# Altium schematic sheet Buck.SchDoc
size 420 x 297 mm; SheetNumber: 1; SheetTotal: 1; ENG_APP_DATE: --/--/--; DSN_APP_DATE: --/--/--; CHK_APP_DATE: --/--/--; SPICEModelCacheCJHNTGTK: <root> / <DocumentId>CJHNTGTK</DocumentId> / <CacheFrame Number="0"> / <Model Name="mcp6561" Kind="CKT"> / <Text>.SUBCKT MCP6561 1 2 3 4 5 / *               | | | | | / *               | | | | Output / *               | | | Negative Supply / *               | | Positive Supply / *               | Inverting Input / *               Non-inverting Input / * / ******************************************************************************** / * Software License Agreement                                                   * / *                                                                              * / * The software supplied herewith by Microchip Technology Incorporated (the     * / * 'Company') is intended and supplied to you, the Company's customer, for use  * / * soley and exclusively on Microchip products.                                 * / *                                                                              * / * The software is owned by the Company and/or its supplier, and is protected   * / * under applicable copyright laws. All rights are reserved. Any use in         * / * violation of the foregoing restrictions may subject the user to criminal     * / * sanctions under applicable laws, as well as to civil liability for the       * / * breach of the terms and conditions of this license.                          * / *                                                                              * / * THIS SOFTWARE IS PROVIDED IN AN 'AS IS' CONDITION. NO WARRANTIES, WHETHER    * / * EXPRESS, IMPLIED OR STATUTORY, INCLUDING, BUT NOT LIMITED TO, IMPLIED        * / * WARRANTIES OF MERCHANTABILITY AND FITNESS FOR A PARTICULAR PURPOSE APPLY TO  * / * THIS SOFTWARE. THE COMPANY SHALL NOT, IN ANY CIRCUMSTANCES, BE LIABLE FOR    * / * SPECIAL, INCIDENTAL OR CONSEQUENTIAL DAMAGES, FOR ANY REASON WHATSOEVER.     * / ******************************************************************************** / * / * The following op-amps are covered by this model: / *      MCP6561/1R/1U/2/4 / * / * / * Revision History: / *      REV A: 31-Jan-11, Created model / *      REV B: 09-Apr-11, Fixed output voltage swing / * / * Recommendations: / *      Use PSPICE (or SPICE 2G6; other simulators may require translation) / *      For a quick, effective design, use a combination of: data sheet / *            specs, bench testing, and simulations with this macromodel / *      For high impedance circuits, set GMIN=100F in the .OPTIONS statement / *      Can disable Hysteresis for faster response in large circuits by adding comments / *      in front of statements flagged below / * / * Supported: / *      Typical performance for temperature range (-40 to 125) degrees Celsius / *      DC, AC, Transient, and Noise analyses. / *      Most specs, including: offsets, DC PSRR, DC CMRR, input impedance, / *            open loop gain, voltage ranges, supply current, ... , etc. / *      Temperature effects for Ibias, Iquiescent, Iout short circuit / *            current, Vsat on both rails, Slew Rate vs. Temp and P.S. / * / * Not Supported: / *      Some Variation in specs vs. Power Supply Voltage / *      Vos distribution, Ib distribution for Monte Carlo / *      Distortion (detailed non-linear behavior) / *      Some Temperature analysis / *      Process variation / *      Behavior outside normal operating region / * / * Input Stage / V10  3 10 -450M / R10 10 11 690K / R11 10 12 690K / G10 10 11 10 11 144U / G11 10 12 10 12 144U / C11 11 12 576E-18 / C12  1  0 4.00P / *E12 71 14 POLY(6) 20 0 21 0 22 0 23 0 26 0 27 0   2.1M 86.2K 86.2K 86.2K 86.2K 1 1 / E12 71 14 POLY(7) 20 0 21 0 22 0 23 0 26 0 27 0 111 0 / + 1.5M 55 55 15 15 1 1 -.5M / * LINE ABOVE FOR HYSTERESIS, LINE BELOW FOR NO HYSTERESIS / *+ 1.5M 55 55 15 15 1 1 0 / G12 1 0 62 0 1m / G13 1 2 63 0 1u / M12 11 14 15 15 NMI / M14 12 2 15 15 NMI / G14 2 0 62 0 1m / C14  2  0 4.00P / I15 15 4 50.0U / V16 16 4 -250M / GD16 16 1 TABLE {V(16,1)} ((-100,-100E-15)(0,0)(1m,1u)(2m,1m)) / V13 3 13 -250M / GD13 2 13 TABLE {V(2,13)} ((-100,-100E-15)(0,0)(1m,1u)(2m,1m)) / R71  1  0 10.0E12 / R72  2  0 10.0E12 / R73  1  2 10.0E12 / *C13  1  2 1.00E-15 / * / * Noise, PSRR, and CMRR / I20 21 20 423U / D20 20  0 DN1 / D21  0 21 DN1 / I22 22 23 1N / R22 22 0  1k / R23  0 23 1k / G26  0 26 POLY(2) 3 0 4 0   0.00 -316U -316U / R26 26  0 1 / G27  0 27 POLY(2) 1 0 2 0  -2.75M 158U 158U / R27 27  0 1 / * / * Open Loop Gain, Slew Rate / G30  0 30 12 11 1 / R30 30  0 1.00K / G31 0 31 3 4 14.7 / I31 0 31 DC 13.7 / R31 31  0 1 TC=0.00,0.00 / GD31 30 0 TABLE {V(30,31)} ((-100,-1n)(0,0)(1m,0.1)(2m,2)) / G32 32 0 3 4 14.7 / I32 32 0 DC 13.7 / R32 32  0 1 TC=0.00,0.00 / GD32 0 30 TABLE {V(30,32)} ((-2m,2)(-1m,0.1)(0,0)(100,-1n)) / G33  0 33 30 0 1m / R33  33 0 1K / G34  0 34 33 0 1.00 / R34  34 0 1K / C34  34 0 353N / G37  0 37 34 0 1m / R37  37 0 1K / C37  37 0 15.9E-15 / G38  0 38 37 0 1m / R38  39 0 1K / L38  38 39 15.9N / E38  35 0 38 0 1 / G35 33 0 TABLE {V(35,3)} ((-1,-1n)(0,0)(2.00,1n))(2.2,1)) / G36 33 0 TABLE {V(35,4)} ((-2.2,-1)((-2.00,-1n)(0,0)(1,1n)) / * / * Output Stage / R80 50 0 100MEG / G50 0 50 57 96 2 / R58 57  96 0.50 / R57 57  0 10.0 / C58  5  0 2.00P / G57  0 57 POLY(3) 3 0 4 0 35 0 0 37.5M 50.0M 100M / GD55 55 57 TABLE {V(55,57)} ((-2m,-1)(-1m,-1m)(0,0)(10,1n)) / GD56 57 56 TABLE {V(57,56)} ((-2m,-1)(-1m,-1m)(0,0)(10,1n)) / E55 55  0 POLY(2) 3 0 51 0 0.00 1 -40.0M / E56 56  0 POLY(2) 4 0 52 0 1.36M 1 -17.8M / R51 51 0 1k / R52 52 0 1k / GD51 50 51 TABLE {V(50,51)} ((-10,-1n)(0,0)(1m,1m)(2m,1)) / GD52 50 52 TABLE {V(50,52)}  ((-2m,-1)(-1m,-1m)(0,0)(10,1n)) / G53  3  0 POLY(1) 51 0  -50.0U 1M / G54  0  4 POLY(1) 52 0  -50.0U -1M / * / * Current Limit / G99 96 5 99 0 1 / R98 0 98 1 TC=-1.00M,2.20U / G97 0 98 TABLE { V(96,5) } ((-11.0,-6.5M)(-1.00M,-6.43M)(0,0)(1.00M,6.43M)(11.0,6.5M)) / *E97 99 0 VALUE { V(98)*((V(3)-V(4))*2.39 + -3.30)} / E97 99 0 VALUE { V(98)*LIMIT(((V(3)-V(4))*2.39 + -3.30),0.00,1E6)} / D98 4 5 DESD / D99 5 3 DESD / * / * Temperature / Voltage Sensitive IQuiscent / R61 0 61 1 TC=2.36M,-625N / G61 3 4 61 0 1 / G60 0 61 TABLE {V(3, 4)} / + ((0,0)(800M,930N)(1.8,88.0U)(2.00,89.0U) / + (3.00,90.0U)(5.00,94.0U)(6.00,97.0U)) / * / * Temperature Sensitive offset voltage / I73 0 70 DC 1uA / *R74 0 70 1 TC=2.00 / R74 0 70 1 TC=0.00 / E75 1 71 70 0 1 / * / * Temp Sensistive IBias / I62 0 62 DC 1uA / R62 0 62 REXP  9.47302M / * / * Temp Sensistive Offset IBias / I63 0 63 DC 1uA / R63 0 63 250M TC=473M,5.03M / * / * Hysteresis / G110 0 110 POLY(2) 3 0 4 0  10.1 -100M 100M / R110 110 0 1 TC=1.8M,0 / *E111 111 0 VALUE { V(110) * SGN(V(57) } / * LINE ABOVE CAUSED CONVERGENCE ERROR, USE TWO LINES BELOW INSTEAD / E111 111 0 VALUE { V(110) * V(112) } / E112 112 0 TABLE {V(120,0)} ((-1,1)(-1m,0.99)(1m,-0.99)(1,-1)) / C120  120 0  1u / G120 0 120 TABLE {V(57,4)} ((-1m,-1)(1m,1)) / R120 0 120 1 / C121 121 120 2p / C122 122 120 2p / V121 121 0 1 / V122 122 0 -1 / * Node 120 above is output of FF.  Can substitute with node 57 for / * direct input from output state. / * / * Hyst FF Node 120 is output of FF / *X_U113 0 0 113 114 120 115 $G_DPWR $G_DGND DFFRSH / *E114 114 0 TABLE {V(57,0)}((-1,-1n)(1m,0)(2m,4)(1,4.01)) / *R113 0 115 1k / *E113 113 0 TABLE {V(57,0)}((-1,4.01)(-2m,4)(-1m,1n)(0,0)) / * / * / * Models / .MODEL NMI NMOS(L=2.00U W=42.0U KP=20.0U LEVEL=1 ) / .MODEL DESD  D   N=1 IS=1.00E-15 / .MODEL DN1 D   IS=1P KF=50.0P AF=1 / .MODEL REXP  RES TCE= 4.41236 / .ENDS MCP6561</Text> / </Model> / </CacheFrame> / </root>
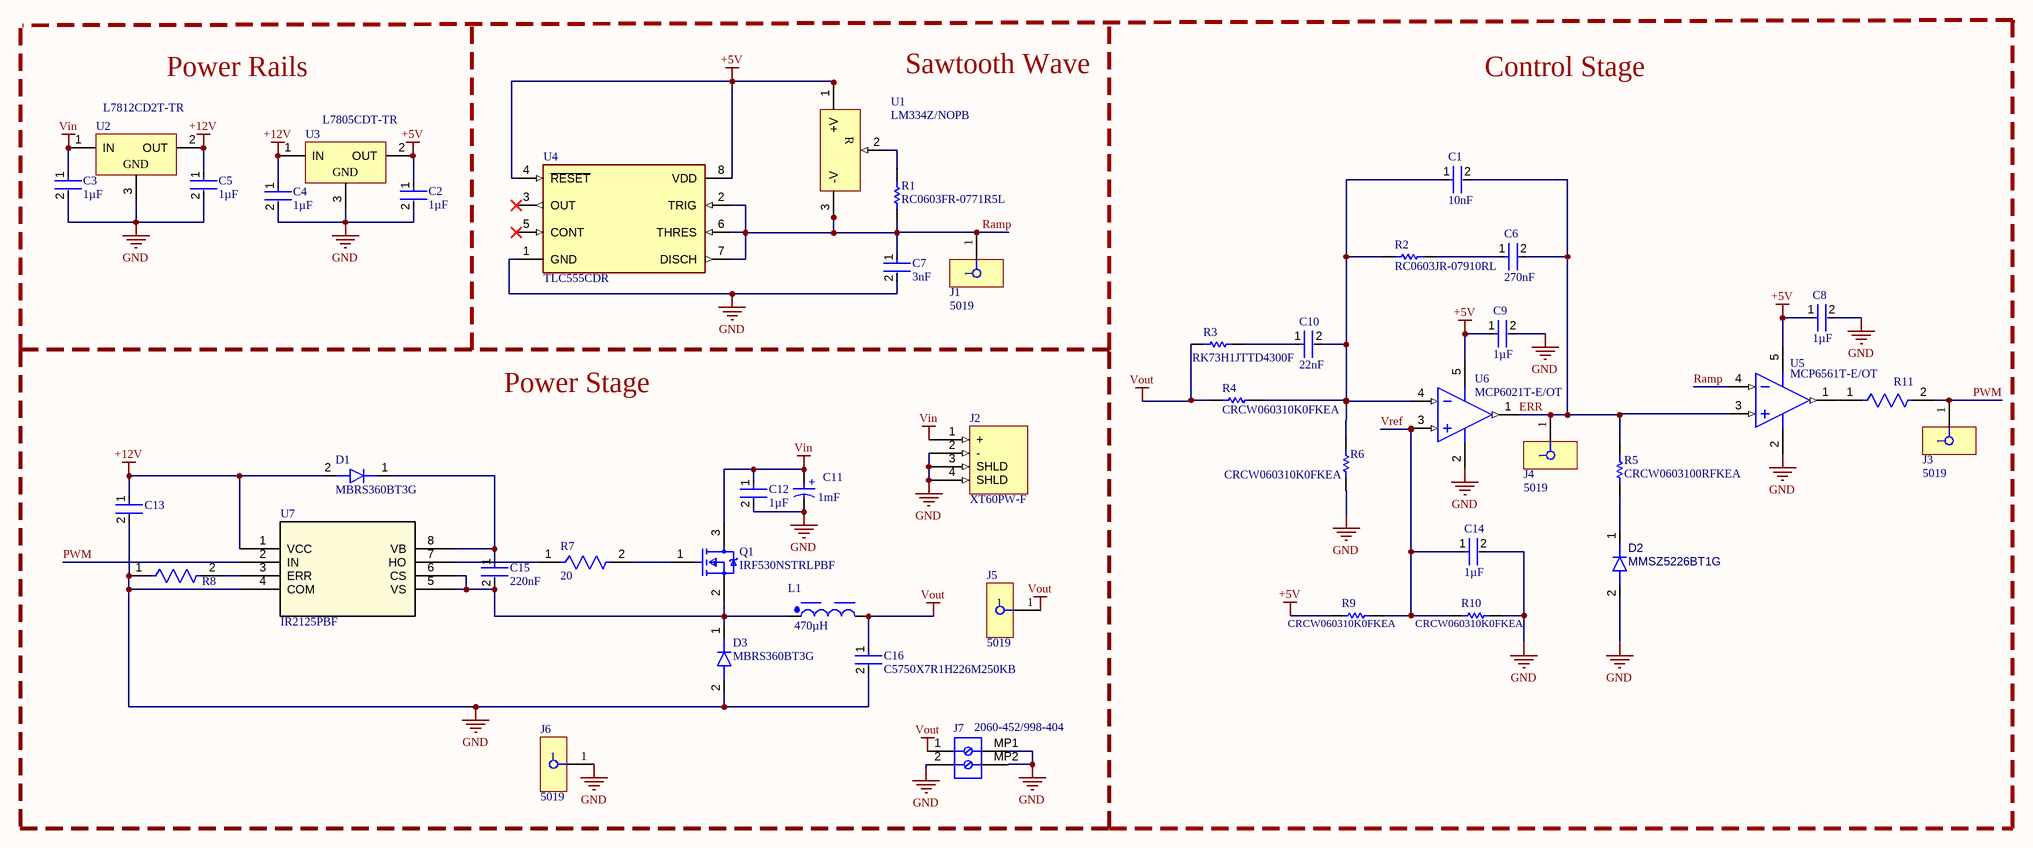
[diagram p0: Buck.SchDoc]

## Parts
C1  value 10nF  [FP-CC0603-DA-IPC_B]  (hidden comment: CC0603KRX7R9BB103)
C2  value 1µF  [FP-0603-L_1_6_0_15-W_0_8-IPC_C]  (hidden comment: UMK107AB7105KA-T)
C3  value 1µF  [FP-0603-L_1_6_0_15-W_0_8-IPC_C]  (hidden comment: UMK107AB7105KA-T)
C4  value 1µF  [FP-0603-L_1_6_0_15-W_0_8-IPC_C]  (hidden comment: UMK107AB7105KA-T)
C5  value 1µF  [FP-0603-L_1_6_0_15-W_0_8-IPC_C]  (hidden comment: UMK107AB7105KA-T)
C6  value 270nF  [FP-GCM188-0_1-IPC_B]  (hidden comment: GCM188R71C274KA37D)
C7  value 3nF  [FP-GCM188-0_1-IPC_B]  (hidden comment: GCM1885C1H302FA16J)
C8  value 1µF  [FP-0603-L_1_6_0_15-W_0_8-IPC_C]  (hidden comment: UMK107AB7105KA-T)
C9  value 1µF  [FP-0603-L_1_6_0_15-W_0_8-IPC_C]  (hidden comment: UMK107AB7105KA-T)
C10  value 22nF  [FP-C0603C-CF-IPC_B]  (hidden comment: C0603C223K5RACTU)
C11  value 1mF  [WCAP-ASLL_D16H17]  (hidden comment: 865060663015)
C12  value 1µF  [FP-0603-L_1_6_0_15-W_0_8-IPC_C]  (hidden comment: UMK107AB7105KA-T)
C13  GRT188R61H225KE13D  [FP-GRT188-0_2-MFG]  (value not drawn)
C14  value 1µF  [FP-0603-L_1_6_0_15-W_0_8-IPC_C]  (hidden comment: UMK107AB7105KA-T)
C15  value 220nF  [FP-GCM188-0_1-IPC_B]  (hidden comment: GCM188R71H224KA64D)
C16  C5750X7R1H226M250KB  [FP-C5750-250-0_4-IPC_C]
D1  MBRS360BT3G  [ONSC-SMB-2-403A-03_H_V]
D2  MMSZ5226BT1G  [SOD-123_ONS]
D3  MBRS360BT3G  [ONSC-SMB-2-403A-03_H_V]
J1  5019  [5019_MFG]
J2  XT60PW-F  [AMASS_XT60PW-F]
J3  5019  [5019_MFG]
J4  5019  [5019_MFG]
J5  5019  [5019_MFG]
J6  5019  [5019_MFG]
J7  2060-452/998-404  [WAGO-2060-452_V]
L1  value 470µH  [WE-HCF_2920]  (hidden comment: 74437529203471)
Q1  IRF530NSTRLPBF  [FP-PG-TO263-3-MFG]
R1  RC0603FR-0771R5L  [RESC1608X55X25NL10T15]
R2  RC0603JR-07910RL  [RESC1608X55X25LL10T15]
R3  RK73H1JTTD4300F  [RESC1608X55X30LL20T10]
R4  CRCW060310K0FKEA  [RESC1609X50X30NL8T20]
R5  CRCW0603100RFKEA  [RESC1609X50X30ML8T20]
R6  CRCW060310K0FKEA  [RESC1609X50X30NL8T20]
R7  value 20  [FP-RMCF0603-MFG]  (hidden comment: RMCF0603JT20R0)
R8  RNCP1206FTD10K0  [FP-RNCP1206-IPC_B]  (value not drawn)
R9  CRCW060310K0FKEA  [RESC1609X50X30NL8T20]
R10  CRCW060310K0FKEA  [RESC1609X50X30NL8T20]
R11  CR0603AFX-1000ELF  [FP-CR0603-IPC_A]  (value not drawn)
U1  LM334Z/NOPB  [LP0003A]
U2  L7812CD2T-TR  [TO-263_L]
U3  L7805CDT-TR  [TO-252_L]
U4  TLC555CDR  [FP-D0008A-IPC_B]
U5  MCP6561T-E/OT  [SOT-23-OT5_N]
U6  MCP6021T-E/OT  [SOT-23-5_MC_MCH-M]
U7  IR2125PBF  [PDIP8_INF]

## Blocks framed on the sheet
Power Stage: C11-C13 C15 C16 D1 D3 J2 J5-J7 L1 Q1 R7 R8 U7

## Nets
+5V: C2.1 C8.1 C9.1 R9.1 U1.1(+V) U3.2(OUT) U4.4(~{RESET}) U4.8(VDD) U5.5(VDD) U6.5(VDD)
+12V: C4.1 C5.1 C13.1 D1.2(A) U2.2(OUT) U3.1(IN) U7.1(VCC)
GND: C2.2 C3.2 C4.2 C5.2 C7.2 C8.2 C9.2 C11.2(N) C12.2 C13.2 C14.2 C16.2 D2.2(A) D3.2(A) J2.2(-) J2.3(SHLD) J2.4(SHLD) J6.1 J7.2 J7.MP1 J7.MP2 R6.2 R8.1 R10.2 U2.3(GND) U3.3(GND) U4.1(GND) U5.2(VSS) U6.2(VSS) U7.4(COM)
Vin: C3.1 C11.1(P) C12.1 J2.1(+) Q1.3(D) U2.1(IN)
Vout: C16.1 J5.1 J7.1 L1.2 R3.1 R4.1
ERR: C1.2 C6.2 J4.1 R5.2 U5.3(IN+) U6.1(OUT)
PWM: J3.1 R11.2 U7.2(IN)
Ramp: C7.1 J1.1 R1.1 U1.3(-V) U4.2(TRIG) U4.6(THRES) U4.7(DISCH) U5.4(IN-)
Vref: C14.1 R9.2 R10.1 U6.3(IN+)
NetC1_1: C1.1 C10.2 R2.1 R4.2 R6.1 U6.4(IN-)
NetC6_1: C6.1 R2.2
NetC10_1: C10.1 R3.2
NetC15_1: C15.1 D1.1(K) U7.8(VB)
NetC15_2: C15.2 D3.1(K) L1.1 Q1.2(S) U7.5(VS) U7.6(CS)
NetD2_1: D2.1(K) R5.1
NetQ1_1: Q1.1(G) R7.2
NetR1_2: R1.2 U1.2(R)
NetR7_1: R7.1 U7.7(HO)
NetR8_2: R8.2 U7.3(ERR)
NetR11_1: R11.1 U5.1(OUT)

Not connected (* = marked no-connect by the designer): U4 3(OUT)* 5(CONT)*

## Notes on the sheet
- Power Rails
- (near U1) Sawtooth Wave
- Control Stage
- THIS DOCUMENT AND THE DATA DISCLOSED HEREIN OR
- HEREWITH IS THE PROPERTY OF ALTIUM LIMITED AND MAY
- DWG NO:
- REVISION
- REV:
- DESCRIPTION
- DATE
- APPROVED
- BE FREELY DISTRIBUTED IN WHOLE. NO RIGHTS ARE
- RESERVED OR EXPRESS OR IMPLIED WARANTEE GIVEN.
- ENG:
- APPROVALS
- PROJECT
- DSN:
- CHK:
- REFERENCE DOCUMENTS
- PROJECT REVISION:
- TITLE
- DOCUMENT REVISION:
- DESIGN ITEM:
- BOM:
- FAB DWG:
- PCB DWG:
- ASSY DWG:
- SCALE:
- A3
- SIZE
- CAGE CODE
- FILE NAME
- DWG NO.
- SHEET
- OF
- REV
- (in symbol CMP-001-00088-3) +

## Library data of the parts
C1 = CMP-001-00087-2: 50V 10nF X7R ±10% 0603 Multilayer Ceramic Capacitors MLCC - SMD/SMT ROHS; Insulation Resistance: 100GΩ; Max Operating Temperature: 125°C; Composition: Ceramic; Case Code (Metric): 1608; REACH SVHC: Unaffected; Dielectric: X7R; RoHS: Compliant; Pins: 2; Export Control Classification Number (ECCN) Code: EAR99; Tolerance: 10%; Length: 1.6mm; Depth: 800µm; Halogen Free: Halogen Free; China RoHS: Compliant; Mounting Technology: Surface Mount; Lead Free: Lead Free; Min Operating Temperature: -55°C; Voltage Rating (DC): 50V; Lifecycle Status: Production; Harmonized Tariff Schedule (HTS) Code: 8532.24.00.20; Material: Ceramic; Termination: SMD/SMT; Height: 800µm; Voltage: 50V; Radiation Hardening: No; Number of Terminals: 2; Schedule B: 8532240020, 8532240020; Introduction Date: 2003-01-27; Thickness: 889µm; Voltage Rating: 50V; Width: 800µm; Case/Package: 0603; Case Code (Imperial): 0603; Country of Origin: Mainland China, Taiwan; Dielectric Material: Ceramic
C2-C5 C8 C9 C12 C14 = CMP-001-00089-1: 50V 1uF X7R 卤10% 0603 Multilayer Ceramic Capacitors MLCC - SMD/SMT ROHS; Tolerance: 10%; Lifecycle Status: Production; Thickness: 939.8µm; Case/Package: 0603; Dielectric Material: Ceramic; Termination: SMD/SMT; Length: 1.6mm; RoHS: Compliant; Min Operating Temperature: -55°C; Mounting Technology: Surface Mount; Halogen Free: Halogen Free; Material: Ceramic; Number of Terminals: 2; REACH SVHC: Unaffected; Case Code (Imperial): 0603; Voltage Rating (DC): 50V; Case Code (Metric): 1608; Dielectric: X7R; Radiation Hardening: No; Width: 800µm; Voltage Rating: 50V; Max Operating Temperature: 125°C; Depth: 800µm; Height: 800µm
C6 = CMP-001-00091-1: Cap Ceramic 0.27uF 16V X7R 10% Pad SMD 0603 125C Automotive T/R; Manufacturer Lifecycle Status: IN PRODUCTION; Voltage Rating (DC): 16V; Dielectric: X7R; Max Operating Temperature: 125°C; Lifecycle Status: Production; Width: 800µm; Min Operating Temperature: -55°C; Export Control Classification Number (ECCN) Code: EAR99; Thickness: 800µm; RoHS: Compliant; Introduction Date: 2010-10-29; Harmonized Tariff Schedule (HTS) Code: 8532.24.00.20; Mounting Technology: Surface Mount; Height: 800µm; Country of Origin: Philippines; Dielectric Material: Ceramic; Length: 1.6mm; Number of Terminals: 2; REACH SVHC: Unaffected; Material: Ceramic; Tolerance: 10%; Case/Package: 0603; Schedule B: 8532240020, 8532240020; Voltage Rating: 16V; Ratings: AEC-Q200
C7 = CMP-001-00090-1: MLCC 3nF ±1% C0G(NP0) 0603 SMD, Adhesive Mount 1.6mm × 800μm × 800μm; Manufacturer Lifecycle Status: IN PRODUCTION; Temperature Coefficient: 30ppm/°C; Voltage Rating (DC): 50V; Material: Ceramic; Case/Package: 0603; Voltage Rating: 50V; Thickness: 800µm; Length: 1.6mm; RoHS: Compliant; Width: 800µm; Height: 800µm; Min Operating Temperature: -55°C; Ratings: AEC-Q200; Tolerance: 1%; REACH SVHC: Unaffected; Dielectric Material: Ceramic; Number of Terminals: 2; Lifecycle Status: Production; Mounting Technology: Surface Mount; Max Operating Temperature: 125°C
C10 = CMP-001-00092-1: CAP CER 0.022UF 50V X7R 0603 / 0.022 µF ±10% 50V Ceramic Capacitor X7R 0603 (1608 Metric); Dissipation Factor: 2.5%; Temperature Coefficient: 30ppm/°C; Introduction Date: 2011-08-12; Lead Pitch: 700µm; Case Code (Imperial): 0603; Voltage: 50V; Width: 800µm; Radiation Hardening: No; Thickness: 863.6µm; Export Control Classification Number (ECCN) Code: EAR99; Mounting Technology: Surface Mount; Contact Plating: Tin; REACH SVHC: Unaffected; China RoHS: Compliant; Dielectric: X7R; Tolerance: 10%; Voltage Rating (DC): 50V; Case/Package: 0603; RoHS: Compliant; Material: Ceramic; Lead Free: Lead Free; Packaging: Cut Tape; Country of Origin: Mexico; Depth: 800µm; Max Operating Temperature: 125°C; Pins: 2; Dielectric Material: Ceramic; Lifecycle Status: Production; Length: 1.6mm; Number of Terminals: 2; Termination: SMD/SMT; Harmonized Tariff Schedule (HTS) Code: 8532.24.00.20; Height: 800µm; Min Operating Temperature: -55°C; Voltage Rating: 50V; Schedule B: 8532240020, 8532240020
C11 = CMP-001-00088-3: Alum. Electrolytic Cap 1000UF 50V 17MMV-CHIP Wcap-asll, Lifetime 5000H +105OC; Manufacturer Lifecycle Status: ACTIVE; Polarity: Polar; Tolerance: 20%; YEOL: 1 = Estimated lifetime > 10 years; ESR (Equivalent Series Resistance): 55.6696mΩ; Ripple Current: 1.61A; Impedance: 73mΩ; Leakage Current: 500µA; Life (Hours): 5000hours; Insulation Resistance: 100kΩ; Min Operating Temperature: -55°C; Max Operating Temperature: 105°C; Length: 17mm; Mounting Technology: Surface Mount; Case/Package: Radial; RoHS: Compliant; Voltage Rating: 50V; Lifecycle Status: Production; REACH SVHC: Unknown; Voltage Rating (DC): 50V; Height: 17mm; Ripple Current (AC): 1.61A; Diameter: 16mm; Width: 17.1mm; Height - Seated (Max): 16.9926mm
C13 = CMP-06035-008514-1: Multi-Layer Ceramic Capacitor 2.2uF 50V X5R ±10% 0603 Paper T/R; Case Code (Metric): 1608; Voltage Rating: 50V; Thickness: 0.035inch; Min Operating Temperature: -55°C; Length: 0.063inch; Tolerance: 10%; Case/Package: 0603; Mount: Surface Mount; Max Operating Temperature: 85°C; Capacitance: 2.2uF; Dielectric: X5R; Voltage Rating (DC): 50V; Ratings: AEC-Q200; Width: 0.031inch; Case Code (Imperial): 0603; Packaging: Tape and Reel
C15 = CMP-001-00093-1: 50V 220nF X7R ±10% 0603 Multilayer Ceramic Capacitors MLCC - SMD/SMT ROHS; Manufacturer Lifecycle Status: IN PRODUCTION; Voltage Rating (DC): 50V; REACH SVHC: Unaffected; Case/Package: 0603; Lead Free: Lead Free; Schedule B: 8532240020, 8532240020; Number of Terminals: 2; Harmonized Tariff Schedule (HTS) Code: 8532.24.00.20; Depth: 800µm; Country of Origin: Japan, Philippines; Voltage: 50V; Material: Ceramic; Radiation Hardening: No; Ratings: AEC-Q200; Tolerance: 10%; Case Code (Metric): 1608; Lifecycle Status: Production; RoHS: Compliant; Height: 800µm; Export Control Classification Number (ECCN) Code: EAR99; Voltage Rating: 50V; Packaging: Tape & Reel; Max Operating Temperature: 125°C; Dielectric Material: Ceramic; Width: 800µm; Mounting Technology: Surface Mount; Case Code (Imperial): 0603; Min Operating Temperature: -55°C; Length: 1.6mm; Termination: SMD/SMT; Dielectric: X7R; Introduction Date: 2010-10-29
C16 = CMP-08246-002715-1: Multilayer Ceramic Capacitors 22uF ±20% 50V X7R SMD 2220
D1 D3 = CMP-004-00033-2: Rectifier Diode, Schottky, 1 Phase, 1 Element, 3A, 60V V(RRM), Silicon, DO-214AA; Manufacturer Lifecycle Status: ACTIVE; Forward Voltage: 630mV; Peak Non-Repetitive Surge Current: 125A; Number of Elements: 1; Element Configuration: Single; Max Reverse Leakage Current: 150µA; Peak Reverse Current: 30µA; Lifecycle Status: Production; Height: 2.27mm; Max Operating Temperature: 175°C; Case/Package: SMB; Halogen Free: Halogen Free; Max Repetitive Reverse Voltage (Vrrm): 60V; Number of Terminals: 2; Pins: 2; China RoHS: Non-Compliant; Contact Plating: Tin; Max Output current: 3A; Reverse Standoff Voltage: 60V; Max Reverse Voltage (DC): 60V; RoHS: Compliant; Packaging: Tape and Reel; Length: 4.6mm; Min Operating Temperature: -65°C; Max Forward Surge Current (Ifsm): 125A; Width: 3.95mm; Radiation Hardening: No; Average Rectified Current: 3A; REACH SVHC: Affected; Max Surge Current: 125A; Schedule B: 8541100080; Lead Free: Lead Free
D2 = CMP-004-00032-3: MMSZ5226BT1 Series 500 mW 10 mA 3.3 V SMT Zener Voltage Regulator - SOD-123; Manufacturer Lifecycle Status: ACTIVE; Zener Current: 20mA; Tolerance: 5%; Voltage Rating (DC): 3.3V; Impedance: 28Ω; Power Dissipation: 500mW; ESD Protection: Yes; Forward Voltage: 900mV; Polarity: Unidirectional; Max Reverse Leakage Current: 25µA; Number of Elements: 1; Breakdown Voltage: 3.47V; Material: Plastic; Length: 2.69mm; Width: 1.6mm; Lead Free: Lead Free; Lifecycle Status: Production; China RoHS: Compliant; Test Current: 20mA; Zener Voltage: 3.3V; Composition: Zener; Radiation Hardening: No; Voltage Tolerance: 5%; Max Operating Temperature: 150°C; Min Operating Temperature: -55°C; Pins: 2; Contact Plating: Tin; RoHS: Compliant; Max Power Dissipation: 500mW; Packaging: Tape and Reel; Number of Terminals: 2; Reference Voltage: 3.3V; Schedule B: 8541100050, 8541100050; Case/Package: SOD-123-2; Working Voltage: 3.3V; Peak Reverse Current: 25µA; Power Rating: 500mW; REACH SVHC: Unaffected; Height: 1.12mm
J1 J3-J6 = CMP-1672-00008-3: Phosphor Bronze Contact Miniature Silver Plated Surface Mount Test Points; Number of Contacts: 1; ComponentLink1Description: Manufacturer's Website; Number of Pins: 1; Height: 2.42mm; Mount: Surface Mount; HelpURL: https://www.keyelco.com/product-pdf.cfm?p=1357; REACH SVHC: Yes; Packaging: Tape and Reel; Lead Free: Lead Free; ComponentLink1URL: http://www.keyelco.com/; Termination: SMD/SMT; Material: Bronze; Contact Plating: Silver; Contact Material: Silver; RoHS: Compliant; ComponentLink2URL: https://www.keyelco.com/product-pdf.cfm?p=1357; China RoHS: Compliant; Lifecycle Status: Production; ComponentLink2Description: Datasheet URL
J2 = CMP-002-00074-1: Screw Type Terminal; Gender: Female; Pins: 4; Color: Yellow; Mounting Technology: Through Hole; Contact Material: Brass
J7 = CMP-2000-05527-1: Terminal Block, Pitch 4 mm, 1 x 2 Position, Height 4.5 mm, -60 to 105 degC, RoHS, Tape and Reel; Manufacturer: WAGO; Number of contacts: 2; Content: 1pc(s); Min. cross section (flexible): 0.25mm²; Stripping length: 6-7mm; Nominal current: 9A; Nominal voltage: 160V; Pitch: 4mm; Min. cross section (unflexible): 0.2mm²; Max. cross section (inflexible): 0.75mm²; AWG: 24-18; Connection: Pullspring; Type: 2060-452/998-404; Package Reference: 2060-452; Mounting Technology: SurfaceMount; Colour: White; Package Description: Terminal Block, Pitch 4 mm, 1 x 2 Position, Height 4.5 mm; Height: 4.5mm; Manufacturer URL: http://global.wago.com/en/index-en.jsp; Material: PPA-GFenclosure·Tin-platedcoppercontacts; Width: 10.1mm; Manufacturer part No.: 2060-452/998-404; Datasheet URL: http://www.wago.com/infomaterial/pdf/60255126.pdf; Contact material: Tinplated; Length: 7.9mm; Max. cross section (flexible): 0.75mm²; Datasheet Version: 03/2015
L1 = CMP-006-00021-7: Power Choke Shielded Wirewound 470uH 20% 100KHz Ferrite 5.5A 0.0918Ohm DCR Tray Automotive AEC-Q200; Manufacturer Lifecycle Status: ACTIVE; YEOL: 1 = Estimated lifetime > 10 years; Saturation Current: 3.2A; DC Resistance (DCR): 83.45mΩ; Inductance Tolerance: 20%; Lifecycle Status: Production; Max Operating Temperature: 125°C; Width: 28mm; Ambient Temperature Range High: 75°C; Ambient Temperature Range Low: -40°C; Min Operating Temperature: -40°C; Length: 25mm; Height: 20.5mm; RoHS: Compliant
Q1 = CMP-013-00035-1: Mosfet, Power; N-ch; Vdss 100V; Rds(on) 90MILLIOHMS; Id 17A; D2PAK; Pd 70W; Vgs +/-20V; On-State Resistance: 90mΩ; Max Junction Temperature (Tj): 175°C; Fall Time: 25ns; Turn-Off Delay Time: 35ns; Number of Elements: 1; Element Configuration: Single; Gate to Source Voltage (Vgs): 20V; Power Dissipation: 3.8W; Turn-On Delay Time: 9.2ns; Threshold Voltage: 4V; Rise Time: 22ns; Input Capacitance: 920pF; Pins: 3; Schedule B: 8541290080, 8541290080; Lifecycle Status: Production; Case/Package: D2PAK; Length: 10.668mm; Min Operating Temperature: -55°C; Width: 9.65mm; Current Rating: 17A; Harmonized Tariff Schedule (HTS) Code: 8541.29.00.95; Max Power Dissipation: 70W; Contact Plating: Tin; REACH SVHC: Affected; Drain to Source Breakdown Voltage: 100V; Introduction Date: 2007-08-18; China RoHS: Non-Compliant; Lead Free: Lead Free; Drain to Source Resistance: 90mΩ; RoHS: Compliant; Voltage Rating (DC): 100V; Number of Channels: 1; Package Quantity: 800; Max Operating Temperature: 175°C; Height: 5.084mm; Nominal Vgs: 4V; Rds On Max: 90mΩ; Drain to Source Voltage (Vds): 100V; Continuous Drain Current (ID): 17A; Radiation Hardening: No; Mounting Technology: Surface Mount; Export Control Classification Number (ECCN) Code: EAR99; Number of Terminals: 2; Min Breakdown Voltage: 100V; Country of Origin: Mainland China
R1 = CMP-2000-04126-1: Manufacturer: Yageo; Part Number: RC0603FR-0771R5L
R2 = CMP-2000-04296-1: Manufacturer: Yageo; Part Number: RC0603JR-07910RL
R3 = CMP-2000-01500-1: Manufacturer: KOA Speer; Part Number: RK73H1JTTD4300F
R4 R6 R9 R10 = CMP-1666-00005-4: Chip Resistor, 10 KOhm, +/- 1%, 100 mW, -55 to 155 degC, 0603 (1608 Metric), RoHS, Tape and Reel; Manufacturer: Vishay Semiconductor; Voltage Rating: 75 V; Max Operating Temperature: 155 degC; PackageDescription: 2-Pin Surface Mount Device, Body 1.575 x 0.85 mm; ComponentLink1Description: Manufacturer URL; RoHSCompliant: true; PackageReference: 0603; REACH SVHC: Unknown; Length: 1.55 mm; DatasheetVersion: 06/2012; Packaging: Tape and Reel; Min Operating Temperature: -55 degC; Mounting Technology: Surface Mount; ComponentLink2URL: https://datasheet.ciiva.com/11809/0900766b80d98afc-11809037.pdf; Height: 0.45 mm; ComponentLink2Description: Datasheet; Package Quantity: 5000; ComponentLink1URL: http://www.vishay.com/
R5 = CMP-2000-03824-5: Chip Resistor, 100 Ohm, +/- 1%, 100 mW,-55 to 155 degC, 0603 (1608 Metric), RoHS, Tape and Ree; Manufacturer: Vishay Semiconductor; ComponentLink2URL: http://www.vishay.com/docs/20035/dcrcwe3.pdf; ComponentLink1URL: http://www.vishay.com/; Mounting Technology: Surface Mount; ComponentLink1Description: Manufacturer URL; ComponentLink2Description: Datasheet; PackageDescription: 2-Pin Surface Mount Device, Body 1.575 x 0.85 mm; PackageReference: 0603; DatasheetVersion: 06/2012
R7 = CMP-009-00177-1: Res Thick Film 0603 20 Ohm 5% 0.1W(1/10W) ±200ppm/C Pad SMD T/R Automotive AEC-Q200; Max Power Dissipation: 100mW; Temperature Coefficient: 100ppm/°C; Working Voltage: 75V; Number of Terminals: 2; Ratings: AEC-Q200; Min Operating Temperature: -55°C; Export Control Classification Number (ECCN) Code: EAR99; Width: 800µm; Harmonized Tariff Schedule (HTS) Code: 8533.21.00.30; Length: 1.55mm; Case Code (Metric): 1608; RoHS: Compliant; REACH SVHC: Unaffected; Max Operating Temperature: 155°C; Height: 450µm; Country of Origin: Japan, Mainland China, Taiwan; Radiation Hardening: No; Contact Plating: Tin; Introduction Date: 2011-01-07; Composition: Thick Film; Tolerance: 5%; Mounting Technology: Surface Mount; Case/Package: 0603; Features: Automotive AEC-Q200; Packaging: Digi-Reel®; Number of Terminations: 2; Lifecycle Status: Production; Voltage Rating: 75V; China RoHS: Non-Compliant; Schedule B: 8533210045, 8533210045; Case Code (Imperial): 0603; Power Rating: 100mW; Lead Free: Lead Free
R8 = CMP-26527-005574-1: 10kΩ ±1% 0.5W 1206 High Power Anti-Sulfur Thin Film Chip Resistor; Max Power Dissipation: 500mW; Temperature Coefficient: 100ppm/°C; Resistance: 10kR; Resistor Type: Thin Film; Series: RNCP; Case Code (Imperial): 1206; Min Operating Temperature: -55°C; Length: 0.122inch; Case Code (Metric): 3216; Mount: Surface Mount; Max Operating Temperature: 155°C; Height: 0.024inch; Width: 0.059inch; Case/Package: 1206; Number of Terminations: 2; Tolerance: 1%; Features: Moisture Resistant; Packaging: Tape and Reel; RoHS Compliant: Yes
R11 = CMP-07231-000376-1: AEC-Q200 Compliant Chip Resistors 0603 100Ω 0.1W 1% 100ppm/°C
U1 = CMP-019-00049-1: Power Management ICs (PMICs); LM334Z/NOPB; TEXAS INSTRUMENTS; 3; 5.34 mm; 4.3 mm; TO-92; Manufacturer Lifecycle Status: ACTIVE; Output Type: ANALOG; Output Current: 10mA; Accuracy: 3%; Element Configuration: Single; Min Supply Voltage: 800mV; Number of Outputs: 1; Max Supply Voltage: 40V; Min Input Voltage: 1V; Max Power Dissipation: 400mW; Quiescent Current: 1µA; Mounting Technology: Through Hole; Packaging: Box; Contact Plating: Tin; Length: 4.3mm; Radiation Hardening: No; Min Operating Temperature: 0°C; Lifecycle Status: Production; Case/Package: TO-92; Lead Free: Lead Free; RoHS: Compliant; REACH SVHC: Unaffected; Pins: 3; Width: 4.3mm; Height: 5.34mm; Tolerance: 3%; Max Operating Temperature: 70°C; Weight: 453.59237mg; Schedule B: 8542390000, 8542390000; Thickness: 3.6mm; Forward Voltage: 40V; Forward Current: 10mA
U2 = CMP-019-00050-1: STMicroelectronics Linear Regulator IC, 12V Out, 1.5A Max, Single Out, D2PAK, SMD, 3-Pin; Number of Outputs: 1; Dropout Voltage: 2V; Max Junction Temperature (Tj): 125°C; Voltage Tolerance: 4%; Quiescent Current: 8mA; Max Supply Voltage: 25V; Polarity: Positive; Power Supply Rejection Ratio (PSRR): 55dB; Min Input Voltage: 14.5V; Output Type: Fixed; Lead Free: Lead Free; Width: 9.15mm; Height: 4.6mm; Min Operating Temperature: -40°C; Mounting Technology: Surface Mount; Number of Terminals: 2; Pins: 3; RoHS: Compliant; Number of Circuits: 1; Weight: 4.535924g; Packaging: Tape and Reel; Lifecycle Status: Production; Terminal Pitch: 2.54mm; Output Voltage: 12V; Max Output current: 1.5A; Harmonized Tariff Schedule (HTS) Code: 8542.39.00.60; Introduction Date: 1980-01-04; Contact Plating: Tin; Length: 10.2mm; Number of Regulators: 1; Case/Package: TO-263; Number of Channels: 1; Export Control Classification Number (ECCN) Code: EAR99; Height - Seated (Max): 4.83mm; Output Current: 1.5A; Schedule B: 8542390000, 8542390000; Country of Origin: Mainland China; China RoHS: Non-Compliant; Radiation Hardening: No; Max Operating Temperature: 125°C; REACH SVHC: Affected
U3 = CMP-019-00051-1: STMicroelectronics Linear Voltage Regulator, 5V Out, 1.5A Max, DPAK, SMD, 3-Pin; Number of Circuits: 1; Power Supply Rejection Ratio (PSRR): 62dB; Voltage Tolerance: 4%; Max Output Voltage: 5.25V; Polarity: Positive; Dropout Voltage: 2V; Min Output Voltage: 4.75V; Max Supply Voltage: 18V; Quiescent Current: 8mA; Max Junction Temperature (Tj): 125°C; Min Input Voltage: 7V; Output Type: Fixed; Number of Regulators: 1; Number of Outputs: 1; Radiation Hardening: No; RoHS: Compliant; Mounting Technology: Surface Mount; Max Output current: 1.5A; Terminal Pitch: 2.28mm; Contact Plating: Tin; Harmonized Tariff Schedule (HTS) Code: 8542.39.00.60; Width: 6.1mm; Length: 6.5mm; Max Operating Temperature: 125°C; Schedule B: 8542390000, 8542390000; Height: 2.4mm; Packaging: Tape and Reel; Output Current: 1.5A; Lead Free: Lead Free; Output Voltage: 5V; Number of Terminals: 2; Lifecycle Status: Production; China RoHS: Non-Compliant; Country of Origin: Mainland China; Introduction Date: 1980-01-04; Pins: 3; Number of Channels: 1; Export Control Classification Number (ECCN) Code: EAR99; REACH SVHC: Affected; Min Operating Temperature: -40°C; Case/Package: TO-252; Height - Seated (Max): 2.63mm
U4 = CMP-00023-00003-2: Precision Timer ICs; TLC555CDR; TEXAS INSTRUMENTS; SOIC; Surface Mount; 1; 100 mA; Manufacturer Lifecycle Status: ACTIVE; Current Rating: 250A; Number of Channels: 1; Nominal Supply Current: 250µA; Operating Supply Current: 360µA; Frequency: 2.1MHz; Max Power Dissipation: 725mW; High Level Output Current: -10mA; Low Level Output Current: 100mA; Min Supply Voltage: 2V; Max Supply Voltage: 15V; Mounting Technology: Surface Mount; Radiation Hardening: No; Termination: SMD/SMT; Ambient Temperature Range High: 70°C; RoHS: Compliant; Length: 4.9mm; Weight: 72.603129mg; Lifecycle Status: Production; Min Operating Temperature: 0°C; Lead Free: Lead Free; Height: 1.75mm; Width: 3.91mm; Max Operating Temperature: 70°C; Case/Package: SOIC; Quiescent Current: 250µA; Schedule B: 8542390000, 8542390000; Number of Timers/Counters: 1; Pins: 8; Number of Outputs: 1; Power Dissipation: 725mW; REACH SVHC: Unaffected; Thickness: 1.58mm
U5 = CMP-016-00010-1: Analogue Comparator, Single, High Speed, 1 Channels, 49 ns, 1.8V to 5.5V, SOT-23, 5 Pins; Manufacturer Lifecycle Status: REL; Output Type: TTL; Natural Thermal Resistance: 256°C/W; Common Mode Rejection Ratio: 66dB; Turn-On Delay Time: 49ns; Quiescent Current: 130µA; Output Current: 50mA; Number of Elements: 1; Hysteresis: 5mV; Power Supply Rejection Ratio (PSRR): 70dB; Input Bias Current: 1pA; Propagation Delay: 80ns; Output Current per Channel: 25mA; Input Offset Voltage (Vos): 10mV; Harmonized Tariff Schedule (HTS) Code: 8542.33.0001; REACH SVHC: Unaffected; Height: 1.3mm; Radiation Hardening: No; Pins: 5; Packaging: Cut Tape; Country of Fabrication: United States of America; HS Code: 8542.33.0001; Width: 1.8mm; Min Operating Temperature: -40°C; Length: 3.1mm; Max Supply Current: 130µA; Mounting Technology: Surface Mount; Country of Assembly: Thailand; Schedule B: 8542330000, 8542330000; Response Time: 49ns; Introduction Date: 2009-03-10; Number of Channels: 1; Max Supply Voltage: 5.5V; RoHS: Compliant; Nominal Supply Current: 130µA; Lead Free: Lead Free; Country of Origin: Thailand; Type: General Purpose; Lifecycle Status: Production; Export Control Classification Number (ECCN) Code: EAR99; Contact Plating: Tin; Case/Package: SOT-23; Min Supply Voltage: 1.8V; Projected EOL Date: 2034-03-10; Max Input Current: 1pA; Max Operating Temperature: 125°C
U6 = CMP-014-00003-4: MCP6021 Series 5.5 V 10 MHz Rail-to-Rail I/O Operational Amplifier- SOT-23-5; Manufacturer Lifecycle Status: REL; Settling Time: 250ns; Voltage Gain: 110dB; Number of Channels: 1; Max Supply Voltage: 5.5V; Power Supply Rejection Ratio (PSRR): 74dB; Min Input Voltage: 2.5V; Common Mode Rejection Ratio: 70dB; Clock Frequency: 10kHz; Frequency: 10Hz; Input Offset Voltage (Vos): 250µV; Gain Bandwidth Product: 10MHz; Output Current per Channel: 30mA; Operating Supply Current: 1mA; Output Current: 22mA; Input Bias Current: 1pA; Slew Rate: 7V/µs; Height: 1.2954mm; Width: 1.8034mm; RoHS: Compliant; Number of Elements: 1; Radiation Hardening: No; Introduction Date: 2006-03-28; Harmonized Tariff Schedule (HTS) Code: 8542.33.0001; Contact Plating: Tin; Export Control Classification Number (ECCN) Code: EAR99; Min Operating Temperature: -40°C; Number of Circuits: 1; Case/Package: SOT-23; Number of Amplifiers: 1; Schedule B: 8542330000, 8542330000; Country of Origin: Thailand; Max Operating Temperature: 125°C; Lifecycle Status: Production; HS Code: 8542.33.0001; Length: 3.0988mm; Mounting Technology: Surface Mount; Country of Fabrication: United States of America; REACH SVHC: Unaffected; Bandwidth: 10MHz; Pins: 5; Min Supply Voltage: 2.5V; Nominal Supply Current: 1mA; Country of Assembly: Thailand; Lead Free: Lead Free; Projected EOL Date: 2034-03-28
U7 = CMP-00024-00006-2: MOSFET Driver 500 Volt 3.3A 1 Output Hi/Lo Side Non Input Volt 8-Pin PDIP; Rise Time: 43ns; Operating Supply Voltage: 15V; Max Output Voltage: 18V; Output Current: 1.6A; Number of Drivers: 1; Max Junction Temperature (Tj): 150°C; Max Supply Current: 1.2mA; Power Dissipation: 1W; Turn-On Delay Time: 170ns; Propagation Delay: 370ns; Output Voltage: 518V; Fall Time: 26ns; Min Supply Voltage: 0V; Min Output Voltage: 12V; Reference Voltage: 500V; Turn-Off Delay Time: 200ns; Channel Type: Single; Height - Seated (Max): 5.33mm; Case/Package: DIP; Terminal Pitch: 2.54mm; Type: Integrated Circuit (IC); Harmonized Tariff Schedule (HTS) Code: 8542.39.00.60; Schedule B: 8542310000, 8542310000; Max Supply Voltage: 18V; Nominal Supply Voltage (DC): 15V; Mounting Technology: Through Hole; Lead Free: Contains Lead; Length: 9.88mm; Height: 5.33mm; Ambient Temperature Range High: 125°C; Nominal Supply Current: 1.2mA; Lifecycle Status: Production; Package Quantity: 3000; Number of Channels: 1; Export Control Classification Number (ECCN) Code: EAR99; LTB Date: 2013-10-03; RoHS: Compliant; Width: 7.62mm; REACH SVHC: Unaffected; Number of Circuits: 1; LTD Date: 2014-04-03; Number of Terminals: 8; Max Operating Temperature: 125°C; Introduction Date: 1991-03-01; Radiation Hardening: No; Number of Outputs: 1; Min Operating Temperature: -40°C; Max Output current: 3.3A; Pins: 8; Max Power Dissipation: 1W; Temperature Grade: Automotive